# Altium project Task_Tony.PrjPcb (part 1 of 8)
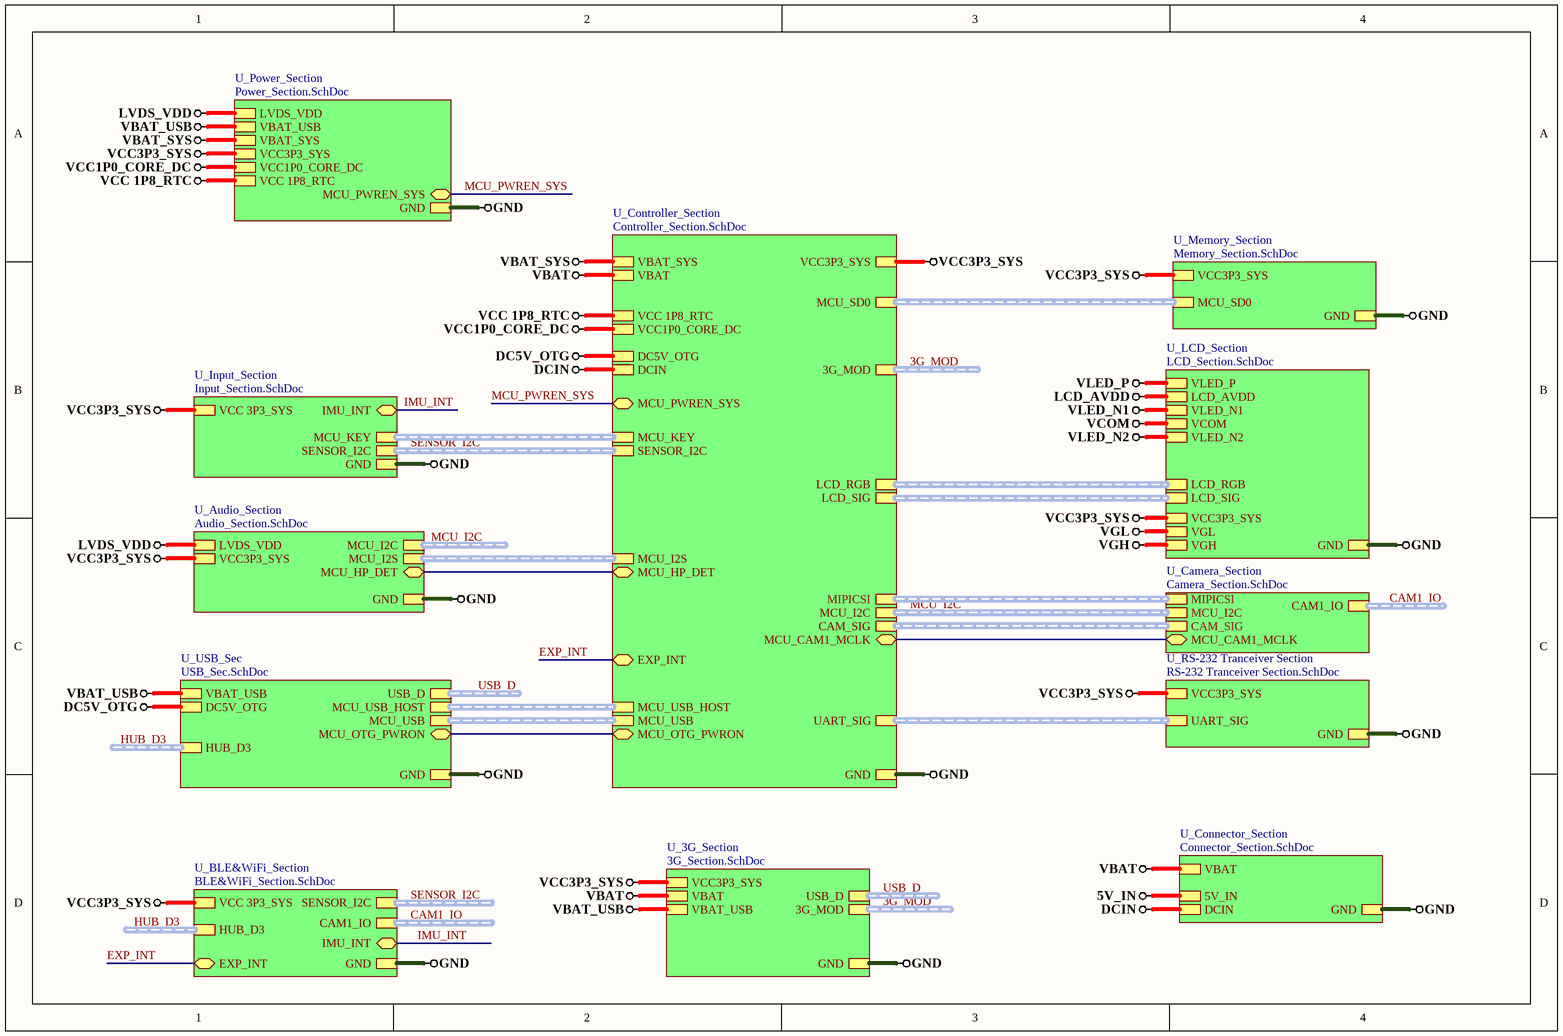
[diagram p0: Top_Sheet.SchDoc]
31 sheets, 275 parts. Net scope: hierarchical (ports join the sheet entries above them; power ports are global).
Board file: Tony_Tablet.PcbDoc
Sheets:
  Top_Sheet.SchDoc
    U_Controller_Section = Controller_Section.SchDoc
      U_Main_Cont = Main_Cont.SchDoc
      U_Main_Cont_2 = Main_Cont_2.SchDoc
      U_Main_Cont_3 = Main_Cont_3.SchDoc
    U_Power_Section = Power_Section.SchDoc
      U_USB_Power = USB_Power.SchDoc
      U_MCU_Core_Power = MCU_Core_Power.SchDoc
      U_RTC_Sec = RTC_Sec.SchDoc
    U_Audio_Section = Audio_Section.SchDoc
      U_MIC_Sec = MIC_Sec.SchDoc
      U_Audio_Codec_Sec = Audio_Codec_Sec.SchDoc
      U_Headphones_Sec = Headphones_Sec.SchDoc
    U_Input_Section = Input_Section.SchDoc
      U_Sensor_Section = Sensor_Section.SchDoc
      U_Key_Buttons = Key_Buttons.SchDoc
    U_USB_Sec = USB_Sec.SchDoc
      U_USB_OTG = USB_OTG.SchDoc
      U_USB_Host = USB_Host.SchDoc
    U_Camera_Section = Camera_Section.SchDoc
    U_Memory_Section = Memory_Section.SchDoc
    U_LCD_Section = LCD_Section.SchDoc
      U_7''_LCD_Connector = 7''_LCD_Connector.SchDoc
      U_LCD_Drive_Sec = LCD_Drive_Sec.SchDoc
    U_Connector_Section = Connector_Section.SchDoc
    U_3G_Section = 3G_Section.SchDoc
      U_USIM_Sec = USIM_Sec.SchDoc
      U_3G_Modem = 3G_Modem.SchDoc
      U_Level_Shifter_Sec = Level_Shifter_Sec.SchDoc
    U_RS-232 Tranceiver Section = RS-232 Tranceiver Section.SchDoc
    U_BLE&WiFi_Section = BLE&WiFi_Section.SchDoc

## Sheet Top_Sheet.SchDoc
size A4; DocumentNumber: 1; SheetNumber: 1; SheetTotal: 28

### Sub-sheets
U_3G_Section = 3G_Section.SchDoc: USB_D (harness USB_D), GND, VCC3P3_SYS, VBAT, VBAT_USB, 3G_MOD (harness 3G_MOD)
U_Audio_Section = Audio_Section.SchDoc: MCU_I2S (harness MCU_I2S), MCU_HP_DET (bidir), LVDS_VDD, VCC3P3_SYS, GND, MCU_I2C (harness MCU_I2C)
U_BLE&WiFi_Section = BLE&WiFi_Section.SchDoc: HUB_D3 (harness HUB_D3), GND, VCC 3P3_SYS, SENSOR_I2C (harness SENSOR_I2C), CAM1_IO (harness CAM1_IO), EXP_INT (bidir), IMU_INT (bidir)
U_Camera_Section = Camera_Section.SchDoc: MCU_I2C (harness MCU_I2C), CAM_SIG (harness CAM_SIG), MCU_CAM1_MCLK (bidir), MIPICSI (harness MIPICSI), CAM1_IO (harness CAM1_IO)
U_Connector_Section = Connector_Section.SchDoc: GND, VBAT, 5V_IN, DCIN
U_Controller_Section = Controller_Section.SchDoc: MCU_HP_DET (bidir), MCU_KEY (harness MCU_KEY), MCU_USB (harness MCU_USB), MCU_SD0 (harness MCU_SD0), MCU_I2C (harness MCU_I2C), MCU_I2S (harness MCU_I2S), CAM_SIG (harness CAM_SIG), MCU_OTG_PWRON (bidir), MCU_CAM1_MCLK (bidir), MCU_USB_HOST (harness MCU_USB_HOST), VCC3P3_SYS, GND, VBAT_SYS, VCC 1P8_RTC, VBAT, VCC1P0_CORE_DC, DC5V_OTG, DCIN, UART_SIG (harness UART_SIG), LCD_RGB (harness LCD_RGB), MCU_PWREN_SYS (bidir), SENSOR_I2C (harness SENSOR_I2C), LCD_SIG (harness LCD_SIG), 3G_MOD (harness 3G_MOD), MIPICSI (harness MIPICSI), EXP_INT (bidir)
U_Input_Section = Input_Section.SchDoc: MCU_KEY (harness MCU_KEY), GND, VCC 3P3_SYS, SENSOR_I2C (harness SENSOR_I2C), IMU_INT (bidir)
U_LCD_Section = LCD_Section.SchDoc: GND, LCD_RGB (harness LCD_RGB), LCD_SIG (harness LCD_SIG), LCD_AVDD, VLED_P, VLED_N1, VCOM, VGL, VGH, VCC3P3_SYS, VLED_N2
U_Memory_Section = Memory_Section.SchDoc: MCU_SD0 (harness MCU_SD0), GND, VCC3P3_SYS
U_Power_Section = Power_Section.SchDoc: GND, LVDS_VDD, VBAT_USB, VBAT_SYS, VCC3P3_SYS, VCC1P0_CORE_DC, VCC 1P8_RTC, MCU_PWREN_SYS (bidir)
U_RS-232 Tranceiver Section = RS-232 Tranceiver Section.SchDoc: GND, VCC3P3_SYS, UART_SIG (harness UART_SIG)
U_USB_Sec = USB_Sec.SchDoc: USB_D (harness USB_D), MCU_USB_HOST (harness MCU_USB_HOST), MCU_USB (harness MCU_USB), MCU_OTG_PWRON (bidir), GND, VBAT_USB, DC5V_OTG, HUB_D3 (harness HUB_D3)

### Nets
5V_IN: sheet U_Connector_Section/5V_IN
DC5V_OTG: sheet U_Controller_Section/DC5V_OTG, sheet U_USB_Sec/DC5V_OTG
DCIN: sheet U_Controller_Section/DCIN, sheet U_Connector_Section/DCIN
GND: sheet U_Controller_Section/GND, sheet U_Power_Section/GND, sheet U_Audio_Section/GND, sheet U_Input_Section/GND, sheet U_USB_Sec/GND, sheet U_Memory_Section/GND, sheet U_LCD_Section/GND, sheet U_Connector_Section/GND, sheet U_3G_Section/GND, sheet U_RS-232 Tranceiver Section/GND, sheet U_BLE&WiFi_Section/GND
LVDS_VDD: sheet U_Power_Section/LVDS_VDD, sheet U_Audio_Section/LVDS_VDD
VBAT: sheet U_Controller_Section/VBAT, sheet U_Connector_Section/VBAT, sheet U_3G_Section/VBAT
VBAT_SYS: sheet U_Controller_Section/VBAT_SYS, sheet U_Power_Section/VBAT_SYS
VBAT_USB: sheet U_Power_Section/VBAT_USB, sheet U_USB_Sec/VBAT_USB, sheet U_3G_Section/VBAT_USB
VCC1P0_CORE_DC: sheet U_Controller_Section/VCC1P0_CORE_DC, sheet U_Power_Section/VCC1P0_CORE_DC
VCC3P3_SYS: sheet U_Controller_Section/VCC3P3_SYS, sheet U_Power_Section/VCC3P3_SYS, sheet U_Audio_Section/VCC3P3_SYS, sheet U_Input_Section/VCC 3P3_SYS, sheet U_Memory_Section/VCC3P3_SYS, sheet U_LCD_Section/VCC3P3_SYS, sheet U_3G_Section/VCC3P3_SYS, sheet U_RS-232 Tranceiver Section/VCC3P3_SYS, sheet U_BLE&WiFi_Section/VCC 3P3_SYS  [project net VCC 3P3_SYS]
VCC 1P8_RTC: sheet U_Controller_Section/VCC 1P8_RTC, sheet U_Power_Section/VCC 1P8_RTC
EXP_INT: sheet U_Controller_Section/EXP_INT, sheet U_BLE&WiFi_Section/EXP_INT
IMU_INT: sheet U_Input_Section/IMU_INT, sheet U_BLE&WiFi_Section/IMU_INT
MCU_CAM1_MCLK: sheet U_Controller_Section/MCU_CAM1_MCLK, sheet U_Camera_Section/MCU_CAM1_MCLK
MCU_HP_DET: sheet U_Controller_Section/MCU_HP_DET, sheet U_Audio_Section/MCU_HP_DET
MCU_OTG_PWRON: sheet U_Controller_Section/MCU_OTG_PWRON, sheet U_USB_Sec/MCU_OTG_PWRON
MCU_PWREN_SYS: sheet U_Controller_Section/MCU_PWREN_SYS, sheet U_Power_Section/MCU_PWREN_SYS

### Buses and harness runs
harness 3G_MOD = sheet U_3G_Section/3G_MOD
harness 3G_MOD = sheet U_Controller_Section/3G_MOD
harness CAM1_IO = sheet U_BLE&WiFi_Section/CAM1_IO
harness CAM1_IO = sheet U_Camera_Section/CAM1_IO
harness HUB_D3 = sheet U_BLE&WiFi_Section/HUB_D3
harness HUB_D3 = sheet U_USB_Sec/HUB_D3
harness MCU_I2C = sheet U_Audio_Section/MCU_I2C
harness MCU_I2C = sheet U_Camera_Section/MCU_I2C = sheet U_Controller_Section/MCU_I2C
harness SENSOR_I2C = sheet U_BLE&WiFi_Section/SENSOR_I2C
harness SENSOR_I2C = sheet U_Controller_Section/SENSOR_I2C = sheet U_Input_Section/SENSOR_I2C
harness sheet U_Audio_Section/MCU_I2S = sheet U_Controller_Section/MCU_I2S
harness sheet U_Camera_Section/CAM_SIG = sheet U_Controller_Section/CAM_SIG
harness sheet U_Camera_Section/MIPICSI = sheet U_Controller_Section/MIPICSI
harness sheet U_Controller_Section/LCD_RGB = sheet U_LCD_Section/LCD_RGB
harness sheet U_Controller_Section/LCD_SIG = sheet U_LCD_Section/LCD_SIG
harness sheet U_Controller_Section/MCU_KEY = sheet U_Input_Section/MCU_KEY
harness sheet U_Controller_Section/MCU_SD0 = sheet U_Memory_Section/MCU_SD0
harness sheet U_Controller_Section/MCU_USB = sheet U_USB_Sec/MCU_USB
harness sheet U_Controller_Section/MCU_USB_HOST = sheet U_USB_Sec/MCU_USB_HOST
harness sheet U_Controller_Section/UART_SIG = sheet U_RS-232 Tranceiver Section/UART_SIG
harness USB_D = sheet U_3G_Section/USB_D
harness USB_D = sheet U_USB_Sec/USB_D

## Sheet Controller_Section.SchDoc
size A4; DocumentNumber: 14; SheetNumber: 14; SheetTotal: 28
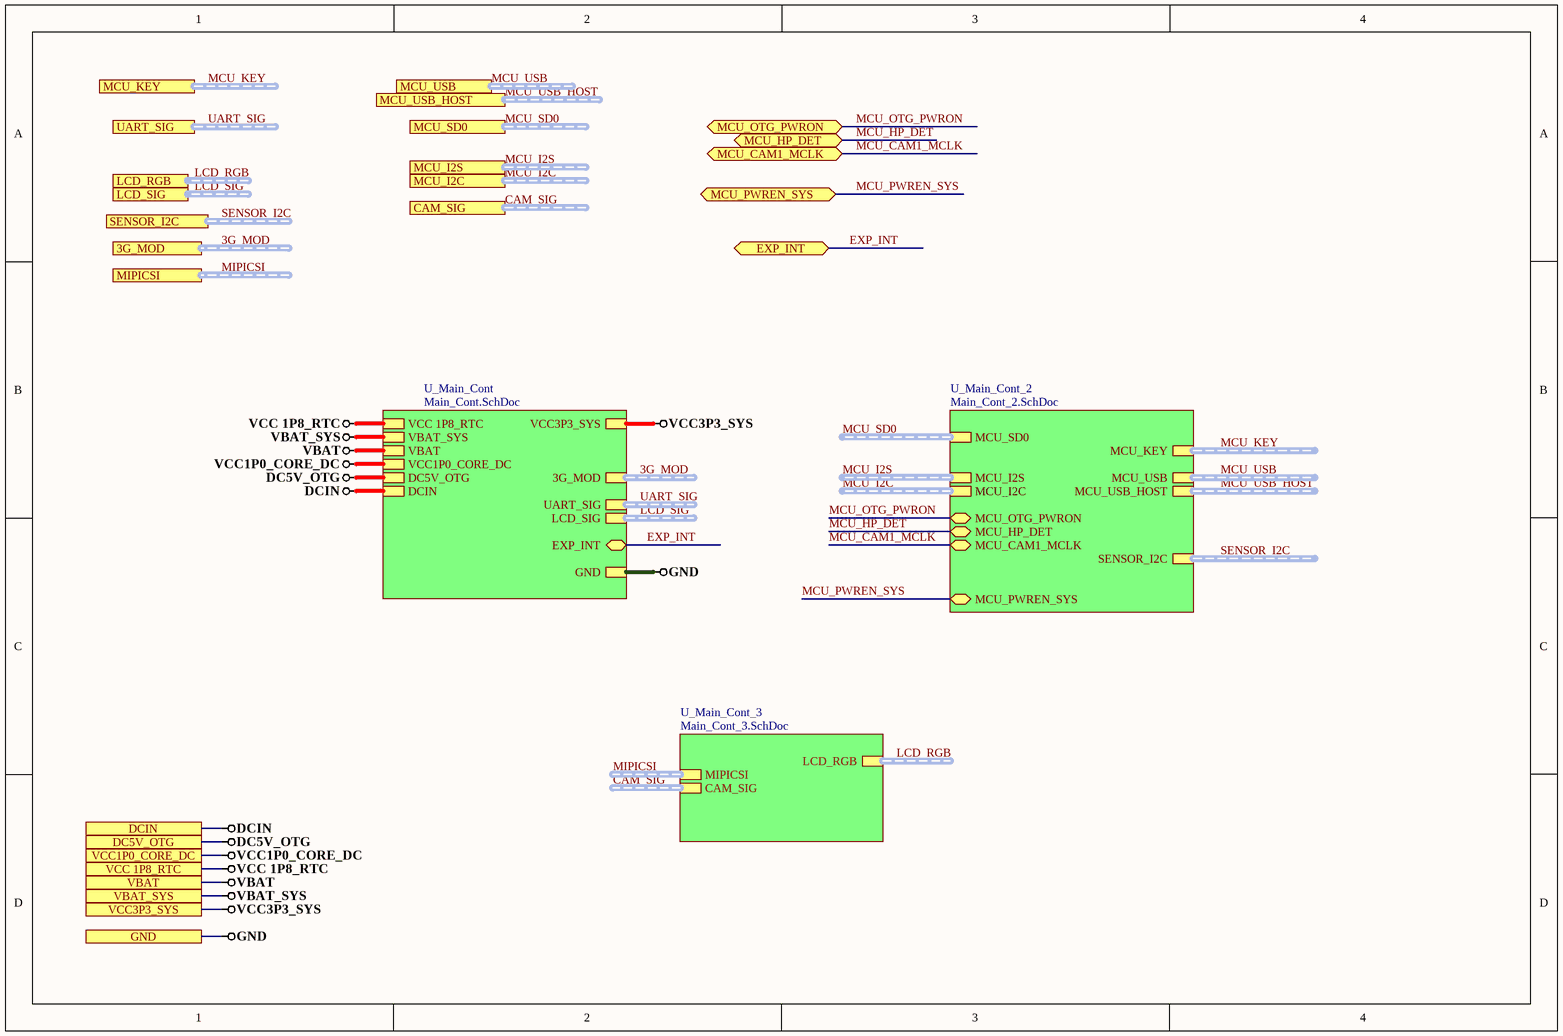
[diagram p1: Controller_Section.SchDoc]

### Sub-sheets
U_Main_Cont = Main_Cont.SchDoc: VCC 1P8_RTC, VBAT_SYS, VBAT, VCC1P0_CORE_DC, DC5V_OTG, DCIN, VCC3P3_SYS, GND, UART_SIG (harness UART_SIG), LCD_SIG (harness LCD_SIG), 3G_MOD (harness 3G_MOD), EXP_INT (bidir)
U_Main_Cont_2 = Main_Cont_2.SchDoc: MCU_SD0 (harness MCU_SD0), MCU_I2S (harness MCU_I2S), MCU_USB (harness MCU_USB), MCU_OTG_PWRON (bidir), MCU_I2C (harness MCU_I2C), MCU_KEY (harness MCU_KEY), MCU_HP_DET (bidir), MCU_CAM1_MCLK (bidir), MCU_USB_HOST (harness MCU_USB_HOST), MCU_PWREN_SYS (bidir), SENSOR_I2C (harness SENSOR_I2C)
U_Main_Cont_3 = Main_Cont_3.SchDoc: CAM_SIG (harness CAM_SIG), LCD_RGB (harness LCD_RGB), MIPICSI (harness MIPICSI)

### Ports
3G_MOD (harness 3G_MOD), CAM_SIG (harness CAM_SIG), DC5V_OTG, DCIN, EXP_INT (bidir), GND, LCD_RGB (harness LCD_RGB), LCD_SIG (harness LCD_SIG), MCU_CAM1_MCLK (bidir), MCU_HP_DET (bidir), MCU_I2C (harness MCU_I2C), MCU_I2S (harness MCU_I2S), MCU_KEY (harness MCU_KEY), MCU_OTG_PWRON (bidir), MCU_PWREN_SYS (bidir), MCU_SD0 (harness MCU_SD0), MCU_USB (harness MCU_USB), MCU_USB_HOST (harness MCU_USB_HOST), MIPICSI (harness MIPICSI), SENSOR_I2C (harness SENSOR_I2C), UART_SIG (harness UART_SIG), VBAT, VBAT_SYS, VCC1P0_CORE_DC, VCC3P3_SYS, VCC 1P8_RTC

### Nets
DC5V_OTG: port DC5V_OTG, sheet U_Main_Cont/DC5V_OTG
DCIN: port DCIN, sheet U_Main_Cont/DCIN
GND: port GND, sheet U_Main_Cont/GND
VBAT: port VBAT, sheet U_Main_Cont/VBAT
VBAT_SYS: port VBAT_SYS, sheet U_Main_Cont/VBAT_SYS
VCC1P0_CORE_DC: port VCC1P0_CORE_DC, sheet U_Main_Cont/VCC1P0_CORE_DC
VCC3P3_SYS: port VCC3P3_SYS, sheet U_Main_Cont/VCC3P3_SYS  [project net VCC 3P3_SYS]
VCC 1P8_RTC: port VCC 1P8_RTC, sheet U_Main_Cont/VCC 1P8_RTC
EXP_INT: port EXP_INT, sheet U_Main_Cont/EXP_INT
MCU_CAM1_MCLK: port MCU_CAM1_MCLK, sheet U_Main_Cont_2/MCU_CAM1_MCLK
MCU_HP_DET: port MCU_HP_DET, sheet U_Main_Cont_2/MCU_HP_DET
MCU_OTG_PWRON: port MCU_OTG_PWRON, sheet U_Main_Cont_2/MCU_OTG_PWRON
MCU_PWREN_SYS: port MCU_PWREN_SYS, sheet U_Main_Cont_2/MCU_PWREN_SYS

### Buses and harness runs
harness 3G_MOD = port 3G_MOD
harness 3G_MOD = sheet U_Main_Cont/3G_MOD
harness CAM_SIG = port CAM_SIG
harness CAM_SIG = sheet U_Main_Cont_3/CAM_SIG
harness LCD_RGB = port LCD_RGB
harness LCD_RGB = sheet U_Main_Cont_3/LCD_RGB
harness LCD_SIG = port LCD_SIG
harness LCD_SIG = sheet U_Main_Cont/LCD_SIG
harness MCU_I2C = port MCU_I2C
harness MCU_I2C = sheet U_Main_Cont_2/MCU_I2C
harness MCU_I2S = port MCU_I2S
harness MCU_I2S = sheet U_Main_Cont_2/MCU_I2S
harness MCU_KEY = port MCU_KEY
harness MCU_KEY = sheet U_Main_Cont_2/MCU_KEY
harness MCU_SD0 = port MCU_SD0
harness MCU_SD0 = sheet U_Main_Cont_2/MCU_SD0
harness MCU_USB = port MCU_USB
harness MCU_USB = sheet U_Main_Cont_2/MCU_USB
harness MCU_USB_HOST = port MCU_USB_HOST
harness MCU_USB_HOST = sheet U_Main_Cont_2/MCU_USB_HOST
harness MIPICSI = port MIPICSI
harness MIPICSI = sheet U_Main_Cont_3/MIPICSI
harness SENSOR_I2C = port SENSOR_I2C
harness SENSOR_I2C = sheet U_Main_Cont_2/SENSOR_I2C
harness UART_SIG = port UART_SIG
harness UART_SIG = sheet U_Main_Cont/UART_SIG

## Sheet Main_Cont.SchDoc
size A4; DocumentNumber: 15; SheetNumber: 15; SheetTotal: 28
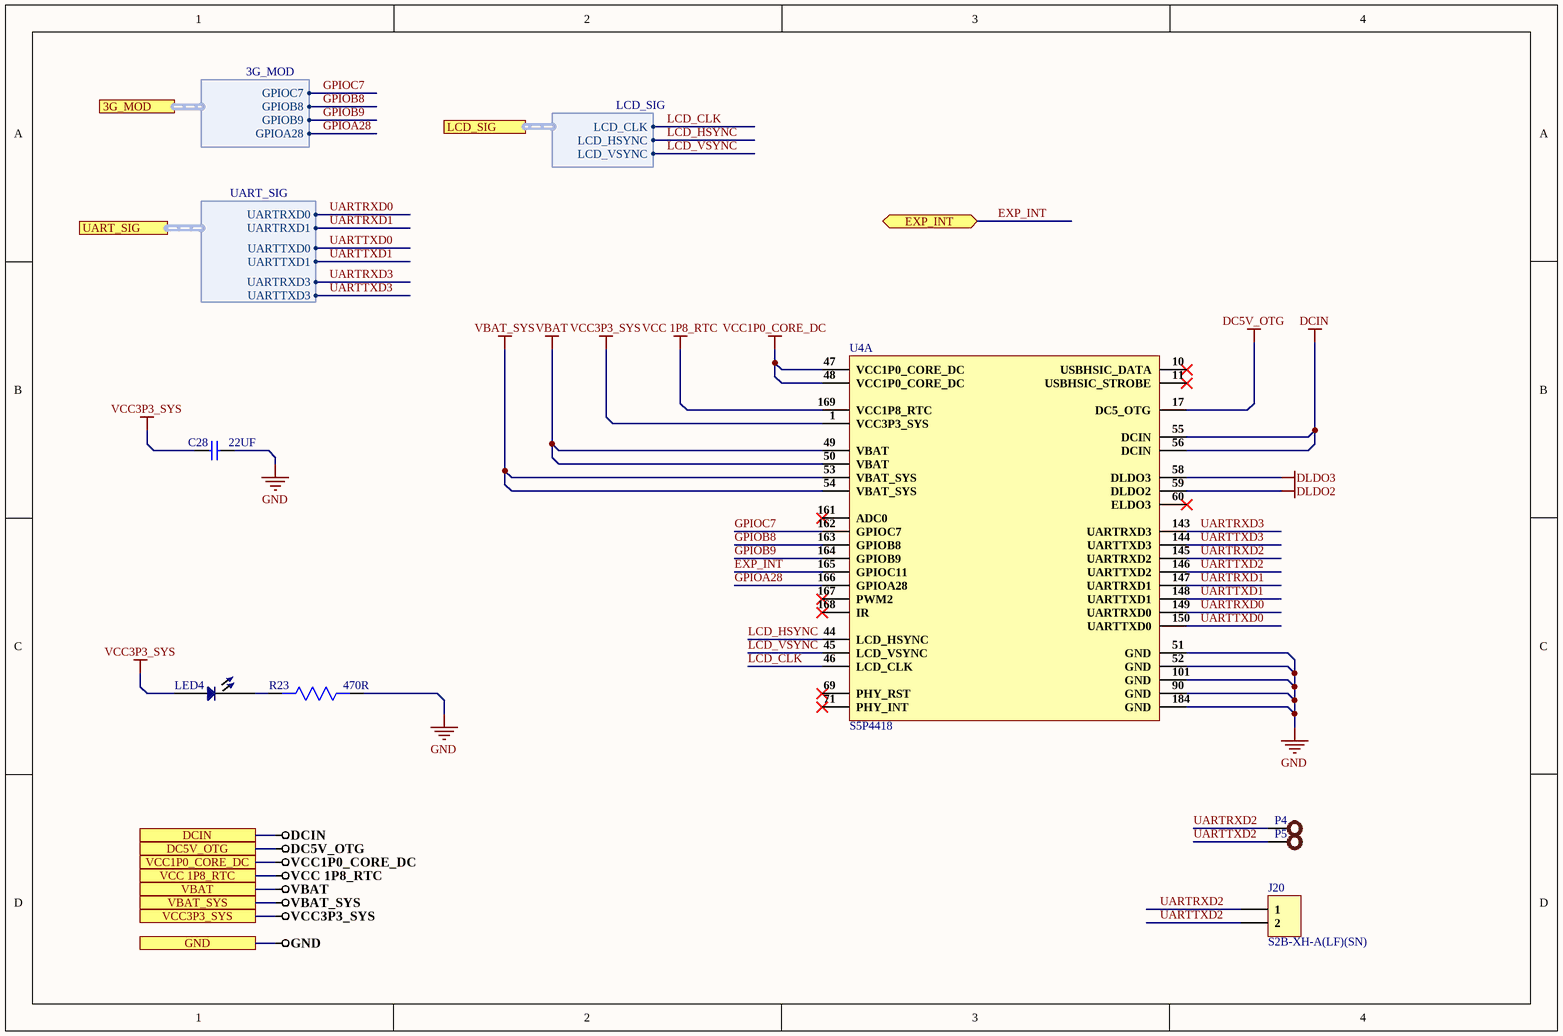
[diagram p2: Main_Cont.SchDoc]

### Parts
C28  22UF  [Cap0805]
J20  S2B-XH-A(LF)(SN)  [S2B-XH-A(LF)(SN)]
LED4  LED Blue  [LED 0402]  (value not drawn)
P4  Test Point  [TEST POINT]  (value not drawn)
P5  Test Point  [TEST POINT]  (value not drawn)
R23  470R  [Res0603]
U4  S5P4418  [S5P4418]  (part A of 6)

### Ports
3G_MOD (harness 3G_MOD), DC5V_OTG, DCIN, EXP_INT (bidir), GND, LCD_SIG (harness LCD_SIG), UART_SIG (harness UART_SIG), VBAT, VBAT_SYS, VCC1P0_CORE_DC, VCC3P3_SYS, VCC 1P8_RTC

### Harnesses
UART_SIG: UARTRXD0, UARTRXD1, UARTTXD0, UARTTXD1, UARTRXD3, UARTTXD3
LCD_SIG: LCD_CLK, LCD_HSYNC, LCD_VSYNC
3G_MOD: GPIOC7, GPIOB8, GPIOB9, GPIOA28

### Nets
DC5V_OTG: U4.17(DC5_OTG) ; port DC5V_OTG
DCIN: U4.55(DCIN) U4.56(DCIN) ; port DCIN
DLDO2: U4.59(DLDO2)  [project net CAM_1.8V]
DLDO3: U4.58(DLDO3)  [project net CAM_2.8V]
GND: C28.2 R23.1 U4.51(GND) U4.52(GND) U4.90(GND) U4.101(GND) U4.184(GND) ; port GND
VBAT: U4.49(VBAT) U4.50(VBAT) ; port VBAT
VBAT_SYS: U4.53(VBAT_SYS) U4.54(VBAT_SYS) ; port VBAT_SYS
VCC1P0_CORE_DC: U4.47(VCC1P0_CORE_DC) U4.48(VCC1P0_CORE_DC) ; port VCC1P0_CORE_DC
VCC3P3_SYS: C28.1 LED4.1 U4.1(VCC3P3_SYS) ; port VCC3P3_SYS  [project net VCC 3P3_SYS]
VCC 1P8_RTC: U4.169(VCC1P8_RTC) ; port VCC 1P8_RTC
EXP_INT: U4.165(GPIOC11) ; port EXP_INT
GPIOA28: U4.166(GPIOA28) ; port 3G_MOD.GPIOA28  [project net 3G_MOD.GPIOA28]
GPIOB8: U4.163(GPIOB8) ; port 3G_MOD.GPIOB8  [project net 3G_MOD.GPIOB8]
GPIOB9: U4.164(GPIOB9) ; port 3G_MOD.GPIOB9  [project net 3G_MOD.GPIOB9]
GPIOC7: U4.162(GPIOC7) ; port 3G_MOD.GPIOC7  [project net 3G_MOD.GPIOC7]
LCD_CLK: U4.46(LCD_CLK) ; port LCD_SIG.LCD_CLK
LCD_HSYNC: U4.44(LCD_HSYNC) ; port LCD_SIG.LCD_HSYNC
LCD_VSYNC: U4.45(LCD_VSYNC) ; port LCD_SIG.LCD_VSYNC  [project net LCD_SIG.LCD_VSYNC]
UARTRXD0: U4.149(UARTRXD0) ; port UART_SIG.UARTRXD0  [project net UART_SIG.UARTRXD0]
UARTRXD1: U4.147(UARTRXD1) ; port UART_SIG.UARTRXD1  [project net UART_SIG.UARTRXD1]
UARTRXD2: J20.1 P4.1 U4.145(UARTRXD2)
UARTRXD3: U4.143(UARTRXD3) ; port UART_SIG.UARTRXD3  [project net UART_SIG.UARTRXD3]
UARTTXD0: U4.150(UARTTXD0) ; port UART_SIG.UARTTXD0  [project net UART_SIG.UARTTXD0]
UARTTXD1: U4.148(UARTTXD1) ; port UART_SIG.UARTTXD1  [project net UART_SIG.UARTTXD1]
UARTTXD2: J20.2 P5.1 U4.146(UARTTXD2)
UARTTXD3: U4.144(UARTTXD3) ; port UART_SIG.UARTTXD3  [project net UART_SIG.UARTTXD3]
NetLED4_2: LED4.2 R23.2

Not connected (* = marked no-connect by the designer): U4 10(USBHSIC_DATA)* 11(USBHSIC_STROBE)* 60(ELDO3)* 69(PHY_RST)* 71(PHY_INT)* 161(ADC0)* 167(PWM2)* 168(IR)*

### Library data of the parts
C28 = C2012X5R1E226M125AC: CAP CER 22UF 25V X5R 0805
J20 = S2B-XH-A(LF)(SN): CONN HEADER R/A 2POS 2.5MM; Manufacturer: JST; Current Rating: 3A; Contact Resistance: 20mR; Voltage Rating (AC): 250V; Number of Positions: 2; Insulation Resistance: 1GR; Gender: Male; Connector Type: Male Pin; Wire/Cable Gauge: 22AWG; Supplier 1: Digi-Key; Manufacturer Part Number: S2B-XH-A(LF)(SN); RoHS: Yes; Category: Headers and Wire Housings; Stock 1: 44898; Pricing 1: 1=0.17000, 10=0.16200, 100=0.11260, 500=0.09524, 1000=0.07792, 5000=0.06927, 10000=0.06277 (USD); Mount: Through Hole; Contact Material: Brass; Contact Plating: Tin,Copper,Lead; Color: Natural; Housing Color: White; Housing Material: Polyamide; Min Operating Temperature: -25°C; Max Operating Temperature: 85°C; Number of Rows: 1; Voltage Rating: 250V; Termination: Press-Fit; Number of Contacts: 2; Max Current Rating: 3A; Package Quantity: 1000; Packaging: Bulk; Max Voltage Rating (AC): 250V; Max Voltage Rating (DC): 250V; Orientation: Right Angle; Length: 7.4mm; Pitch: 2.5mm; Lead Pitch: 2.5mm; Depth: 11.5mm; REACH SVHC: No SVHC; Lead Free: Lead Free; ComponentLink1URL: https://datasheet.ciiva.com/16208/s2b-xh-alfsn-16208978.pdf?src-supplier=Future+Electronics; ComponentLink1Description: https://datasheet.ciiva.com/16208/s2b-xh-alfsn-16208978.pdf?src-supplier=Future+Electronics; ComponentLink2URL: https://datasheet.ciiva.com/8052/1684882-8052211.pdf?src-supplier=Element14; ComponentLink2Description: https://datasheet.ciiva.com/8052/1684882-8052211.pdf?src-supplier=Element14; ComponentLink3URL: https://datasheet.ciiva.com/11746/0900766b8082f560-11746947.pdf?src-supplier=RSComponents; ComponentLink3Description: https://datasheet.ciiva.com/11746/0900766b8082f560-11746947.pdf?src-supplier=RSComponents; ComponentLink4URL: https://datasheet.ciiva.com/26894/getdatasheetpartid-640270-26894603.pdf?src-supplier=Verical; ComponentLink4Description: https://datasheet.ciiva.com/26894/getdatasheetpartid-640270-26894603.pdf?src-supplier=Verical; ComponentLink5URL: https://datasheet.ciiva.com/26924/getdatasheetpartid-645395-26924076.pdf?src-supplier=Verical; ComponentLink5Description: https://datasheet.ciiva.com/26924/getdatasheetpartid-645395-26924076.pdf?src-supplier=Verical; ComponentLink6URL: https://datasheet.ciiva.com/26894/getdatasheetpartid-441330-26894909.pdf?src-supplier=Verical; ComponentLink6Description: https://datasheet.ciiva.com/26894/getdatasheetpartid-441330-26894909.pdf?src-supplier=Verical; ComponentLink7URL: https://datasheet.ciiva.com/726/exh-726412.pdf?src-supplier=Digi-Key; ComponentLink7Description: https://datasheet.ciiva.com/726/exh-726412.pdf?src-supplier=Digi-Key; ComponentLink8URL: https://datasheet.ciiva.com/20207/523653-20207183.pdf?src-supplier=Rapid+Electronics; ComponentLink8Description: https://datasheet.ciiva.com/20207/523653-20207183.pdf?src-supplier=Rapid+Electronics; Supplier Part Number 1: 455-2257-ND
LED4 = APHHS1005QBC/D: LED BLUE CLEAR CHIP SMD 0402; Manufacturer: Kingbright; Lens Colour: Colorless; Forward Current: 20mA; Forward Voltage: 3.3V; Power Rating: 120mW; Luminous Intensity: 60mcd; Viewing Angle: 120°; Dominant Wavelength: 465nm; Supplier 1: Digi-Key; Manufacturer Part Number: APHHS1005QBC/D; Stock 1: 57149; Pricing 1: 1=0.58, 10=0.42, 25=0.3432, 100=0.2746, 250=0.23168, 500=0.19734, 1000=0.15444 (USD); Mount: Surface Mount; Case/Package: 0402; Colour: Blue; Case Code (Metric): 1005; Case Code (Imperial): 0402; Min Operating Temperature: -40°C; Max Operating Temperature: 85°C; Package Quantity: 2000; Illumination Colour: Blue; Packaging: Tape and Reel; Lens Style: Clear; Lens Transparency: Clear; Test Current: 20mA; Length: 1mm; Height: 0.6mm; Width: 0.5mm; Lead Free: Lead Free; ComponentLink1URL: http://www.mouser.com/ds/2/216/APHHS1005QBC-D-54846.pdf; ComponentLink1Description: http://www.mouser.com/ds/2/216/APHHS1005QBC-D-54846.pdf; ComponentLink2URL: http://www.kingbrightusa.com/images/catalog/SPEC/APHHS1005QBC-D.pdf; ComponentLink2Description: http://www.kingbrightusa.com/images/catalog/SPEC/APHHS1005QBC-D.pdf; Supplier Part Number 1: 754-1504-1-ND
P4 P5 = TEST POINT: Test Point ON
R23 = RC0603FR-07470RL: RES SMD 470 OHM 1% 1/10W 0603; Manufacturer: Yageo; Power Rating: 100mW; Voltage Rating: 50V; Temperature Coefficient: 100ppm/°C; Working Voltage: 75V; Supplier 1: Digi-Key; Manufacturer Part Number: RC0603FR-07470RL; Stock 1: 4530601; Pricing 1: 1=0.1, 10=0.023, 100=0.0094, 1000=0.00421, 2500=0.00366 (USD); Case/Package: 0603; Case Code (Metric): 1608; Case Code (Imperial): 0603; Min Operating Temperature: -55°C; Max Operating Temperature: 155°C; Tolerance: 1%; Resistance: 470R; Packaging: Tape and Reel; Package Quantity: 1; Composition: Thick Film; Number of Terminations: 2; Termination: SMD/SMT; Military Standard: Not; Max Power Dissipation: 100mW; Features: Moisture Resistant; Length: 1.6mm; Height: 0.022inch; Width: 0.031inch; Depth: 0.8mm; REACH SVHC: No SVHC; Lead Free: Lead Free; ComponentLink1URL: http://documents.rs-components.com/techlib://itc_doclist_GB.htm?stockno=5047341&src-supplier=RSComponents; ComponentLink1Description: http://documents.rs-components.com/techlib://itc_doclist_GB.htm?stockno=5047341&src-supplier=RSComponents; ComponentLink2URL: http://www.farnell.com/datasheets/1868787.pdf?src-supplier=Element14; ComponentLink2Description: http://www.farnell.com/datasheets/1868787.pdf?src-supplier=Element14; ComponentLink3URL: http://www.farnell.com/datasheets/2167052.pdf?src-supplier=Element14; ComponentLink3Description: http://www.farnell.com/datasheets/2167052.pdf?src-supplier=Element14; ComponentLink4URL: http://www.yageo.com/documents/recent/PYu-RC_Group_51_RoHS_L_10.pdf?src-supplier=Digi-Key; ComponentLink4Description: http://www.yageo.com/documents/recent/PYu-RC_Group_51_RoHS_L_10.pdf?src-supplier=Digi-Key; Supplier Part Number 1: 311-470HRCT-ND
U4 = S5P4418: S5P4418 Quad Core Android SoM System on Module; Manufacturer: Samsung; Value: Custom; Manufacturer Part No: S5P4418; Package: Custom

## Sheet Main_Cont_2.SchDoc
size A4; DocumentNumber: 16; SheetNumber: 16; SheetTotal: 28
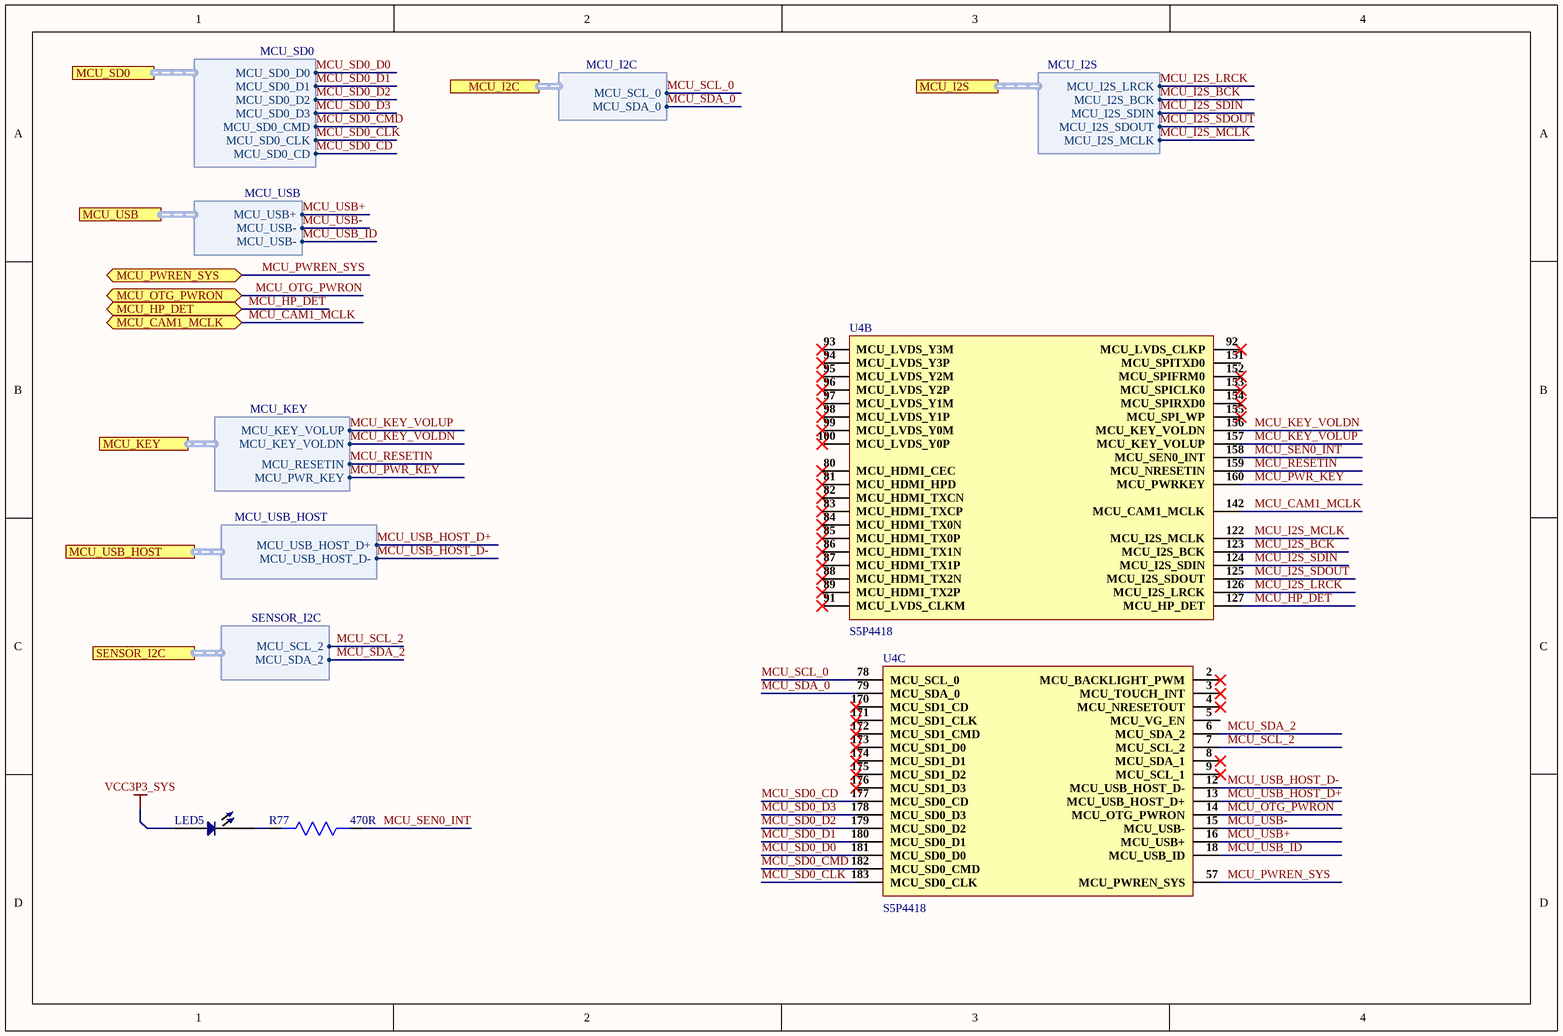
[diagram p3: Main_Cont_2.SchDoc]

### Parts
LED5  LED Blue  [LED 0402]  (value not drawn)
R77  470R  [Res0603]
U4  S5P4418  [S5P4418]  (parts B,C of 6)

### Ports
MCU_CAM1_MCLK (bidir), MCU_HP_DET (bidir), MCU_I2C (harness MCU_I2C), MCU_I2S (harness MCU_I2S), MCU_KEY (harness MCU_KEY), MCU_OTG_PWRON (bidir), MCU_PWREN_SYS (bidir), MCU_SD0 (harness MCU_SD0), MCU_USB (harness MCU_USB), MCU_USB_HOST (harness MCU_USB_HOST), SENSOR_I2C (harness SENSOR_I2C)

### Harnesses
MCU_I2S: MCU_I2S_LRCK, MCU_I2S_BCK, MCU_I2S_SDIN, MCU_I2S_SDOUT, MCU_I2S_MCLK
MCU_I2C: MCU_SCL_0, MCU_SDA_0
MCU_KEY: MCU_KEY_VOLUP, MCU_KEY_VOLDN, MCU_RESETIN, MCU_PWR_KEY
MCU_USB_HOST: MCU_USB_HOST_D+, MCU_USB_HOST_D-
MCU_SD0: MCU_SD0_D0, MCU_SD0_D1, MCU_SD0_D2, MCU_SD0_D3, MCU_SD0_CMD, MCU_SD0_CLK, MCU_SD0_CD
MCU_USB: MCU_USB+, MCU_USB-, MCU_USB-
SENSOR_I2C: MCU_SCL_2, MCU_SDA_2

### Nets
VCC3P3_SYS: LED5.1  [project net VCC 3P3_SYS]
MCU_CAM1_MCLK: U4.142(MCU_CAM1_MCLK) ; port MCU_CAM1_MCLK
MCU_HP_DET: U4.127(MCU_HP_DET) ; port MCU_HP_DET
MCU_I2S_BCK: U4.123(MCU_I2S_BCK) ; port MCU_I2S.MCU_I2S_BCK  [project net MCU_I2S.MCU_I2S_BCK]
MCU_I2S_LRCK: U4.126(MCU_I2S_LRCK) ; port MCU_I2S.MCU_I2S_LRCK  [project net MCU_I2S.MCU_I2S_LRCK]
MCU_I2S_MCLK: U4.122(MCU_I2S_MCLK) ; port MCU_I2S.MCU_I2S_MCLK  [project net MCU_I2S.MCU_I2S_MCLK]
MCU_I2S_SDIN: U4.124(MCU_I2S_SDIN) ; port MCU_I2S.MCU_I2S_SDIN  [project net MCU_I2S.MCU_I2S_SDIN]
MCU_I2S_SDOUT: U4.125(MCU_I2S_SDOUT) ; port MCU_I2S.MCU_I2S_SDOUT  [project net MCU_I2S.MCU_I2S_SDOUT]
MCU_KEY_VOLDN: U4.156(MCU_KEY_VOLDN) ; port MCU_KEY.MCU_KEY_VOLDN  [project net MCU_KEY.MCU_KEY_VOLDN]
MCU_KEY_VOLUP: U4.157(MCU_KEY_VOLUP) ; port MCU_KEY.MCU_KEY_VOLUP  [project net MCU_KEY.MCU_KEY_VOLUP]
MCU_OTG_PWRON: U4.14(MCU_OTG_PWRON) ; port MCU_OTG_PWRON
MCU_PWR_KEY: U4.160(MCU_PWRKEY) ; port MCU_KEY.MCU_PWR_KEY  [project net MCU_KEY.MCU_PWR_KEY]
MCU_PWREN_SYS: U4.57(MCU_PWREN_SYS) ; port MCU_PWREN_SYS
MCU_RESETIN: U4.159(MCU_NRESETIN) ; port MCU_KEY.MCU_RESETIN  [project net MCU_KEY.MCU_RESETIN]
MCU_SCL_0: U4.78(MCU_SCL_0) ; port MCU_I2C.MCU_SCL_0  [project net MCU_I2C.MCU_SCL_0]
MCU_SCL_2: U4.7(MCU_SCL_2) ; port SENSOR_I2C.MCU_SCL_2
MCU_SD0_CD: U4.177(MCU_SD0_CD) ; port MCU_SD0.MCU_SD0_CD  [project net MCU_SD0.MCU_SD0_CD]
MCU_SD0_CLK: U4.183(MCU_SD0_CLK) ; port MCU_SD0.MCU_SD0_CLK  [project net MCU_SD0.MCU_SD0_CLK]
MCU_SD0_CMD: U4.182(MCU_SD0_CMD) ; port MCU_SD0.MCU_SD0_CMD  [project net MCU_SD0.MCU_SD0_CMD]
MCU_SD0_D0: U4.181(MCU_SD0_D0) ; port MCU_SD0.MCU_SD0_D0  [project net MCU_SD0.MCU_SD0_D0]
MCU_SD0_D1: U4.180(MCU_SD0_D1) ; port MCU_SD0.MCU_SD0_D1  [project net MCU_SD0.MCU_SD0_D1]
MCU_SD0_D2: U4.179(MCU_SD0_D2) ; port MCU_SD0.MCU_SD0_D2  [project net MCU_SD0.MCU_SD0_D2]
MCU_SD0_D3: U4.178(MCU_SD0_D3) ; port MCU_SD0.MCU_SD0_D3  [project net MCU_SD0.MCU_SD0_D3]
MCU_SDA_0: U4.79(MCU_SDA_0) ; port MCU_I2C.MCU_SDA_0  [project net MCU_I2C.MCU_SDA_0]
MCU_SDA_2: U4.6(MCU_SDA_2) ; port SENSOR_I2C.MCU_SDA_2
MCU_SEN0_INT: R77.1 U4.158(MCU_SEN0_INT)
MCU_USB+: U4.16(MCU_USB+) ; port MCU_USB.MCU_USB+
MCU_USB-: U4.15(MCU_USB-) U4.18(MCU_USB_ID) ; port MCU_USB.MCU_USB-  [also labelled MCU_USB_ID]
MCU_USB_HOST_D+: U4.13(MCU_USB_HOST_D+) ; port MCU_USB_HOST.MCU_USB_HOST_D+  [project net MCU_USB_HOST.MCU_USB_HOST_D+]
MCU_USB_HOST_D-: U4.12(MCU_USB_HOST_D-) ; port MCU_USB_HOST.MCU_USB_HOST_D-  [project net MCU_USB_HOST.MCU_USB_HOST_D-]
NetLED5_2: LED5.2 R77.2

Not connected (* = marked no-connect by the designer): U4 2(MCU_BACKLIGHT_PWM)* 3(MCU_TOUCH_INT)* 4(MCU_NRESETOUT)* 5(MCU_VG_EN) 8(MCU_SDA_1)* 9(MCU_SCL_1)* 80(MCU_HDMI_CEC)* 81(MCU_HDMI_HPD)* 82(MCU_HDMI_TXCN)* 83(MCU_HDMI_TXCP)* 84(MCU_HDMI_TX0N)* 85(MCU_HDMI_TX0P)* 86(MCU_HDMI_TX1N)* 87(MCU_HDMI_TX1P)* 88(MCU_HDMI_TX2N)* 89(MCU_HDMI_TX2P)* 91(MCU_LVDS_CLKM)* 92(MCU_LVDS_CLKP)* 93(MCU_LVDS_Y3M)* 94(MCU_LVDS_Y3P)* 95(MCU_LVDS_Y2M)* 96(MCU_LVDS_Y2P)* 97(MCU_LVDS_Y1M)* 98(MCU_LVDS_Y1P)* 99(MCU_LVDS_Y0M)* 100(MCU_LVDS_Y0P)* 151(MCU_SPITXD0) 152(MCU_SPIFRM0)* 153(MCU_SPICLK0)* 154(MCU_SPIRXD0)* 155(MCU_SPI_WP)* 170(MCU_SD1_CD)* 171(MCU_SD1_CLK)* 172(MCU_SD1_CMD)* 173(MCU_SD1_D0)* 174(MCU_SD1_D1)* 175(MCU_SD1_D2)* 176(MCU_SD1_D3)*

### Library data of the parts
LED5 = APHHS1005QBC/D: as LED4 on sheet Main_Cont; Supplier 1: Digi-Key; Manufacturer Part Number: APHHS1005QBC/D; Stock 1: 57149; Pricing 1: 1=0.58, 10=0.42, 25=0.3432, 100=0.2746, 250=0.23168, 500=0.19734, 1000=0.15444 (USD); Mount: Surface Mount; Case/Package: 0402; Colour: Blue; Case Code (Metric): 1005; Case Code (Imperial): 0402; Min Operating Temperature: -40°C; Max Operating Temperature: 85°C; Package Quantity: 2000; Illumination Colour: Blue; Packaging: Tape and Reel; Lens Style: Clear; Lens Transparency: Clear; Test Current: 20mA; Length: 1mm; Height: 0.6mm; Width: 0.5mm; Lead Free: Lead Free; ComponentLink1URL: http://www.mouser.com/ds/2/216/APHHS1005QBC-D-54846.pdf; ComponentLink1Description: http://www.mouser.com/ds/2/216/APHHS1005QBC-D-54846.pdf; ComponentLink2URL: http://www.kingbrightusa.com/images/catalog/SPEC/APHHS1005QBC-D.pdf; ComponentLink2Description: http://www.kingbrightusa.com/images/catalog/SPEC/APHHS1005QBC-D.pdf; Supplier Part Number 1: 754-1504-1-ND
R77 = RC0603FR-07470RL: as R23 on sheet Main_Cont; Supplier 1: Digi-Key; Manufacturer Part Number: RC0603FR-07470RL; Stock 1: 4530601; Pricing 1: 1=0.1, 10=0.023, 100=0.0094, 1000=0.00421, 2500=0.00366 (USD); Case/Package: 0603; Case Code (Metric): 1608; Case Code (Imperial): 0603; Min Operating Temperature: -55°C; Max Operating Temperature: 155°C; Tolerance: 1%; Resistance: 470R; Packaging: Tape and Reel; Package Quantity: 1; Composition: Thick Film; Number of Terminations: 2; Termination: SMD/SMT; Military Standard: Not; Max Power Dissipation: 100mW; Features: Moisture Resistant; Length: 1.6mm; Height: 0.022inch; Width: 0.031inch; Depth: 0.8mm; REACH SVHC: No SVHC; Lead Free: Lead Free; ComponentLink1URL: http://documents.rs-components.com/techlib://itc_doclist_GB.htm?stockno=5047341&src-supplier=RSComponents; ComponentLink1Description: http://documents.rs-components.com/techlib://itc_doclist_GB.htm?stockno=5047341&src-supplier=RSComponents; ComponentLink2URL: http://www.farnell.com/datasheets/1868787.pdf?src-supplier=Element14; ComponentLink2Description: http://www.farnell.com/datasheets/1868787.pdf?src-supplier=Element14; ComponentLink3URL: http://www.farnell.com/datasheets/2167052.pdf?src-supplier=Element14; ComponentLink3Description: http://www.farnell.com/datasheets/2167052.pdf?src-supplier=Element14; ComponentLink4URL: http://www.yageo.com/documents/recent/PYu-RC_Group_51_RoHS_L_10.pdf?src-supplier=Digi-Key; ComponentLink4Description: http://www.yageo.com/documents/recent/PYu-RC_Group_51_RoHS_L_10.pdf?src-supplier=Digi-Key; Supplier Part Number 1: 311-470HRCT-ND
U4 = S5P4418: as U4 on sheet Main_Cont; Manufacturer Part No: S5P4418; Package: Custom

## Sheet Main_Cont_3.SchDoc
size A4; DocumentNumber: 17; SheetNumber: 17; SheetTotal: 28
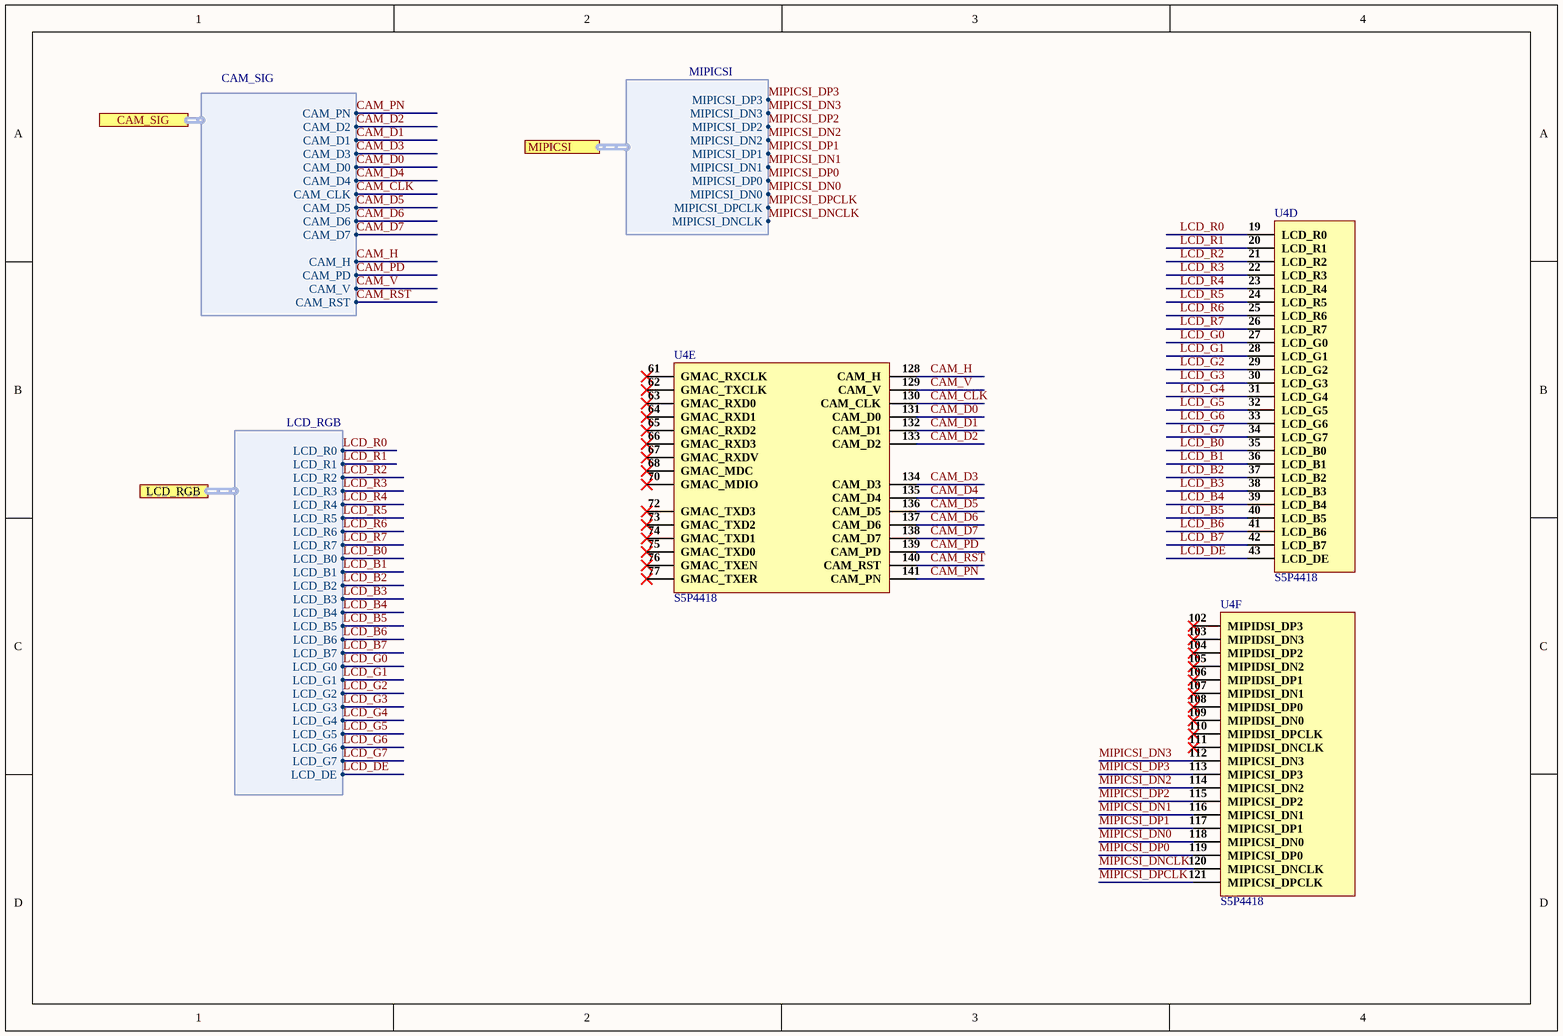
[diagram p4: Main_Cont_3.SchDoc]

### Parts
U4  S5P4418  [S5P4418]  (parts D,E,F of 6)

### Ports
CAM_SIG (harness CAM_SIG), LCD_RGB (harness LCD_RGB), MIPICSI (harness MIPICSI)

### Harnesses
CAM_SIG: CAM_PN, CAM_D2, CAM_D1, CAM_D3, CAM_D4, CAM_D5, CAM_D6, CAM_D7, CAM_H, CAM_PD, CAM_V, CAM_RST, CAM_CLK, CAM_D0
LCD_RGB: LCD_R0, LCD_R1, LCD_R2, LCD_R3, LCD_R5, LCD_R7, LCD_R6, LCD_R4, LCD_B0, LCD_B2, LCD_B4, LCD_B5, LCD_B6, LCD_B7, LCD_B3, LCD_B1, LCD_G0, LCD_G1, LCD_G2, LCD_G3, LCD_G4, LCD_G5, LCD_G6, LCD_G7, LCD_DE
MIPICSI: MIPICSI_DP3, MIPICSI_DN3, MIPICSI_DP2, MIPICSI_DN2, MIPICSI_DP1, MIPICSI_DN1, MIPICSI_DP0, MIPICSI_DN0, MIPICSI_DPCLK, MIPICSI_DNCLK

### Nets
CAM_CLK: U4.130(CAM_CLK) ; port CAM_SIG.CAM_CLK
CAM_D0: U4.131(CAM_D0) ; port CAM_SIG.CAM_D0
CAM_D1: U4.132(CAM_D1) ; port CAM_SIG.CAM_D1
CAM_D2: U4.133(CAM_D2) ; port CAM_SIG.CAM_D2
CAM_D3: U4.134(CAM_D3) ; port CAM_SIG.CAM_D3
CAM_D4: U4.135(CAM_D4) ; port CAM_SIG.CAM_D4
CAM_D5: U4.136(CAM_D5) ; port CAM_SIG.CAM_D5
CAM_D6: U4.137(CAM_D6) ; port CAM_SIG.CAM_D6
CAM_D7: U4.138(CAM_D7) ; port CAM_SIG.CAM_D7
CAM_H: U4.128(CAM_H) ; port CAM_SIG.CAM_H
CAM_PD: U4.139(CAM_PD) ; port CAM_SIG.CAM_PD
CAM_PN: U4.141(CAM_PN) ; port CAM_SIG.CAM_PN
CAM_RST: U4.140(CAM_RST) ; port CAM_SIG.CAM_RST
CAM_V: U4.129(CAM_V) ; port CAM_SIG.CAM_V  [project net CAM_SIG.CAM_V]
LCD_B0: U4.35(LCD_B0) ; port LCD_RGB.LCD_B0
LCD_B1: U4.36(LCD_B1) ; port LCD_RGB.LCD_B1
LCD_B2: U4.37(LCD_B2) ; port LCD_RGB.LCD_B2
LCD_B3: U4.38(LCD_B3) ; port LCD_RGB.LCD_B3
LCD_B4: U4.39(LCD_B4) ; port LCD_RGB.LCD_B4
LCD_B5: U4.40(LCD_B5) ; port LCD_RGB.LCD_B5
LCD_B6: U4.41(LCD_B6) ; port LCD_RGB.LCD_B6
LCD_B7: U4.42(LCD_B7) ; port LCD_RGB.LCD_B7
LCD_DE: U4.43(LCD_DE) ; port LCD_RGB.LCD_DE
LCD_G0: U4.27(LCD_G0) ; port LCD_RGB.LCD_G0
LCD_G1: U4.28(LCD_G1) ; port LCD_RGB.LCD_G1
LCD_G2: U4.29(LCD_G2) ; port LCD_RGB.LCD_G2
LCD_G3: U4.30(LCD_G3) ; port LCD_RGB.LCD_G3
LCD_G4: U4.31(LCD_G4) ; port LCD_RGB.LCD_G4
LCD_G5: U4.32(LCD_G5) ; port LCD_RGB.LCD_G5
LCD_G6: U4.33(LCD_G6) ; port LCD_RGB.LCD_G6
LCD_G7: U4.34(LCD_G7) ; port LCD_RGB.LCD_G7
LCD_R0: U4.19(LCD_R0) ; port LCD_RGB.LCD_R0
LCD_R1: U4.20(LCD_R1) ; port LCD_RGB.LCD_R1
LCD_R2: U4.21(LCD_R2) ; port LCD_RGB.LCD_R2
LCD_R3: U4.22(LCD_R3) ; port LCD_RGB.LCD_R3
LCD_R4: U4.23(LCD_R4) ; port LCD_RGB.LCD_R4
LCD_R5: U4.24(LCD_R5) ; port LCD_RGB.LCD_R5
LCD_R6: U4.25(LCD_R6) ; port LCD_RGB.LCD_R6
LCD_R7: U4.26(LCD_R7) ; port LCD_RGB.LCD_R7
MIPICSI_DN0: U4.118(MIPICSI_DN0) ; port MIPICSI.MIPICSI_DN0  [project net MIPICSI.MIPICSI_DN0]
MIPICSI_DN1: U4.116(MIPICSI_DN1) ; port MIPICSI.MIPICSI_DN1  [project net MIPICSI.MIPICSI_DN1]
MIPICSI_DN2: U4.114(MIPICSI_DN2) ; port MIPICSI.MIPICSI_DN2  [project net MIPICSI.MIPICSI_DN2]
MIPICSI_DN3: U4.112(MIPICSI_DN3) ; port MIPICSI.MIPICSI_DN3  [project net MIPICSI.MIPICSI_DN3]
MIPICSI_DNCLK: U4.120(MIPICSI_DNCLK) ; port MIPICSI.MIPICSI_DNCLK  [project net MIPICSI.MIPICSI_DNCLK]
MIPICSI_DP0: U4.119(MIPICSI_DP0) ; port MIPICSI.MIPICSI_DP0  [project net MIPICSI.MIPICSI_DP0]
MIPICSI_DP1: U4.117(MIPICSI_DP1) ; port MIPICSI.MIPICSI_DP1  [project net MIPICSI.MIPICSI_DP1]
MIPICSI_DP2: U4.115(MIPICSI_DP2) ; port MIPICSI.MIPICSI_DP2  [project net MIPICSI.MIPICSI_DP2]
MIPICSI_DP3: U4.113(MIPICSI_DP3) ; port MIPICSI.MIPICSI_DP3  [project net MIPICSI.MIPICSI_DP3]
MIPICSI_DPCLK: U4.121(MIPICSI_DPCLK) ; port MIPICSI.MIPICSI_DPCLK  [project net MIPICSI.MIPICSI_DPCLK]

Not connected (* = marked no-connect by the designer): U4 61(GMAC_RXCLK)* 62(GMAC_TXCLK)* 63(GMAC_RXD0)* 64(GMAC_RXD1)* 65(GMAC_RXD2)* 66(GMAC_RXD3)* 67(GMAC_RXDV)* 68(GMAC_MDC)* 70(GMAC_MDIO)* 72(GMAC_TXD3)* 73(GMAC_TXD2)* 74(GMAC_TXD1)* 75(GMAC_TXD0)* 76(GMAC_TXEN)* 77(GMAC_TXER)* 102(MIPIDSI_DP3)* 103(MIPIDSI_DN3)* 104(MIPIDSI_DP2)* 105(MIPIDSI_DN2)* 106(MIPIDSI_DP1)* 107(MIPIDSI_DN1)* 108(MIPIDSI_DP0)* 109(MIPIDSI_DN0)* 110(MIPIDSI_DPCLK)* 111(MIPIDSI_DNCLK)*

### Library data of the parts
U4 = S5P4418: as U4 on sheet Main_Cont; Manufacturer Part No: S5P4418; Package: Custom

## Sheet Power_Section.SchDoc
size A4; DocumentNumber: 2; SheetNumber: 2; SheetTotal: 28
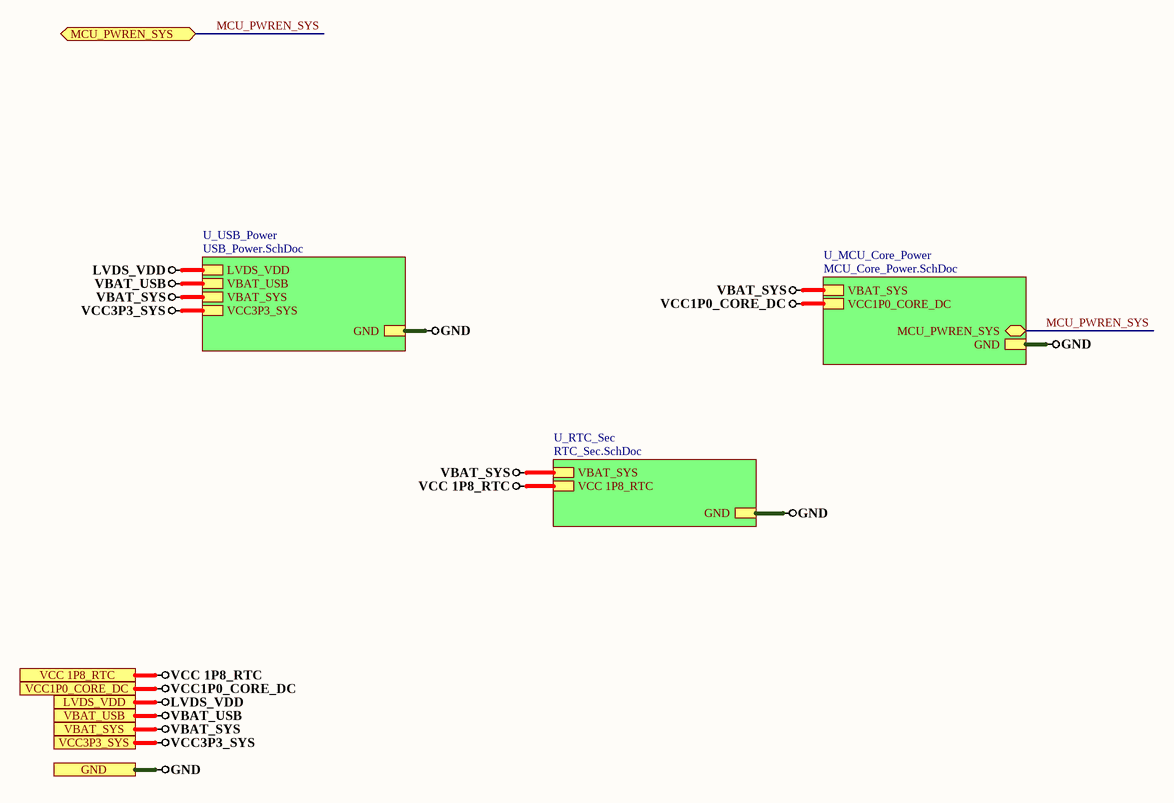
[diagram p5: Power_Section.SchDoc]

### Sub-sheets
U_MCU_Core_Power = MCU_Core_Power.SchDoc: GND, VCC1P0_CORE_DC, VBAT_SYS, MCU_PWREN_SYS (bidir)
U_RTC_Sec = RTC_Sec.SchDoc: GND, VBAT_SYS, VCC 1P8_RTC
U_USB_Power = USB_Power.SchDoc: GND, LVDS_VDD, VBAT_USB, VBAT_SYS, VCC3P3_SYS

### Ports
GND, LVDS_VDD, MCU_PWREN_SYS (bidir), VBAT_SYS, VBAT_USB, VCC1P0_CORE_DC, VCC3P3_SYS, VCC 1P8_RTC

### Nets
GND: port GND, sheet U_USB_Power/GND, sheet U_MCU_Core_Power/GND, sheet U_RTC_Sec/GND
LVDS_VDD: port LVDS_VDD, sheet U_USB_Power/LVDS_VDD
VBAT_SYS: port VBAT_SYS, sheet U_USB_Power/VBAT_SYS, sheet U_MCU_Core_Power/VBAT_SYS, sheet U_RTC_Sec/VBAT_SYS
VBAT_USB: port VBAT_USB, sheet U_USB_Power/VBAT_USB
VCC1P0_CORE_DC: port VCC1P0_CORE_DC, sheet U_MCU_Core_Power/VCC1P0_CORE_DC
VCC3P3_SYS: port VCC3P3_SYS, sheet U_USB_Power/VCC3P3_SYS  [project net VCC 3P3_SYS]
VCC 1P8_RTC: port VCC 1P8_RTC, sheet U_RTC_Sec/VCC 1P8_RTC
MCU_PWREN_SYS: port MCU_PWREN_SYS, sheet U_MCU_Core_Power/MCU_PWREN_SYS